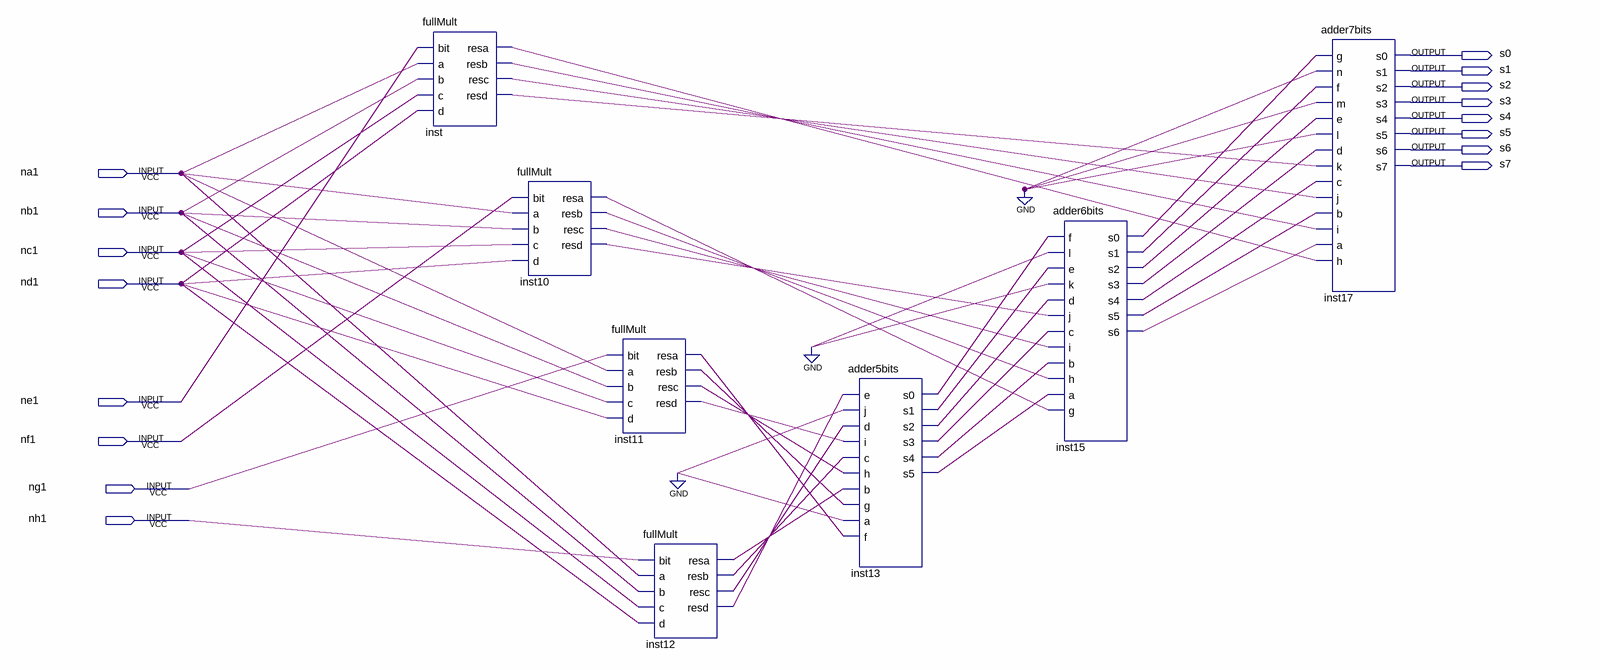
[diagram p0: schematic sheet]
// Quartus schematic mult.bdf as structural Verilog: 7 symbols, 16 pins
module mult (
  input  na1,
  input  nb1,
  input  nc1,
  input  nd1,
  input  ne1,
  input  nf1,
  input  ng1,
  input  nh1,
  output s0,
  output s1,
  output s2,
  output s3,
  output s4,
  output s5,
  output s6,
  output s7
);

  wire inst10_resa, inst10_resb, inst10_resc, inst10_resd, inst11_resa, inst11_resb, inst11_resc,
       inst11_resd, inst12_resa, inst12_resb, inst12_resc, inst12_resd, inst13_s0, inst13_s1, inst13_s2,
       inst13_s3, inst13_s4, inst13_s5, inst15_s0, inst15_s1, inst15_s2, inst15_s3, inst15_s4, inst15_s5,
       inst15_s6, inst_resa, inst_resb, inst_resc, inst_resd;

  fullMult inst (
    .\bit (ne1), .a(na1), .b(nb1), .c(nc1), .d(nd1), .resa(inst_resa), .resb(inst_resb), .resc(inst_resc),
    .resd(inst_resd));
  fullMult inst10 (
    .\bit (nf1), .a(na1), .b(nb1), .c(nc1), .d(nd1), .resa(inst10_resa), .resb(inst10_resb),
    .resc(inst10_resc), .resd(inst10_resd));
  fullMult inst11 (
    .\bit (ng1), .a(na1), .b(nb1), .c(nc1), .d(nd1), .resa(inst11_resa), .resb(inst11_resb),
    .resc(inst11_resc), .resd(inst11_resd));
  fullMult inst12 (
    .\bit (nh1), .a(na1), .b(nb1), .c(nc1), .d(nd1), .resa(inst12_resa), .resb(inst12_resb),
    .resc(inst12_resc), .resd(inst12_resd));
  adder5bits inst13 (
    .e(inst12_resd), .j(1'b0), .d(inst12_resc), .i(inst11_resd), .c(inst12_resb), .h(inst11_resc),
    .b(inst12_resa), .g(inst11_resb), .a(1'b0), .f(inst11_resa), .s0(inst13_s0), .s1(inst13_s1),
    .s2(inst13_s2), .s3(inst13_s3), .s4(inst13_s4), .s5(inst13_s5));
  adder6bits inst15 (
    .f(inst13_s0), .l(1'b0), .e(inst13_s1), .k(1'b0), .d(inst13_s2), .j(inst10_resd), .c(inst13_s3),
    .i(inst10_resc), .b(inst13_s4), .h(inst10_resb), .a(inst13_s5), .g(inst10_resa), .s0(inst15_s0),
    .s1(inst15_s1), .s2(inst15_s2), .s3(inst15_s3), .s4(inst15_s4), .s5(inst15_s5), .s6(inst15_s6));
  adder7bits inst17 (
    .g(inst15_s0), .n(1'b0), .f(inst15_s1), .m(1'b0), .e(inst15_s2), .l(1'b0), .d(inst15_s3), .k(inst_resd),
    .c(inst15_s4), .j(inst_resc), .b(inst15_s5), .i(inst_resb), .a(inst15_s6), .h(inst_resa), .s0(s0),
    .s1(s1), .s2(s2), .s3(s3), .s4(s4), .s5(s5), .s6(s6), .s7(s7));
endmodule
